# Altium schematic sheet Radar.SchDoc
size A; SheetNumber: 2; SheetTotal: 3
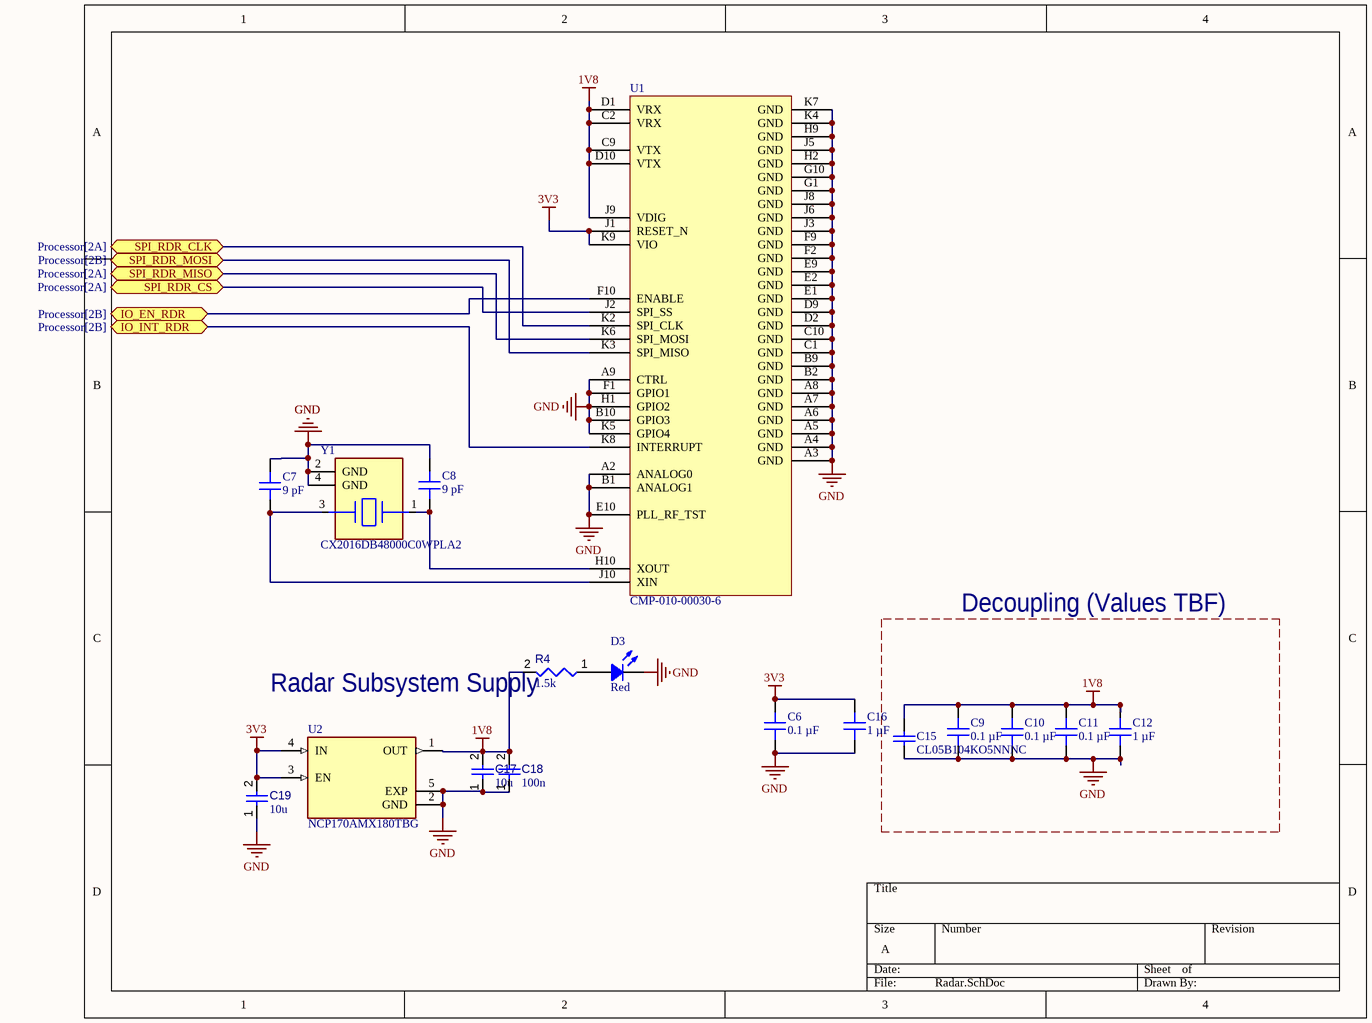
[diagram p0: Radar.SchDoc]

## Parts
C6  0.1 µF  [CAP 0402_1005]
C7  9 pF  [CAP 0402_1005]
C8  9 pF  [CAP 0402_1005]
C9  0.1 µF  [CAP 0402_1005]
C10  0.1 µF  [CAP 0402_1005]
C11  0.1 µF  [CAP 0402_1005]
C12  1 µF  [CAP 0402_1005]
C15  CL05B104KO5NNNC  [CAPC1050X55X23ML05T13]
C16  1 µF  [CAP 0402_1005]
C17  value 10u  [CAPC0402(1005)60_L]  (hidden comment: Capacitor 10µF +/-40% 6.3V 0402)
C18  value 100n  [CAPC0402(1005)60_L]  (hidden comment: Capacitor 10µF +/-40% 6.3V 0402)
C19  value 10u  [CAPC0402(1005)60_L]  (hidden comment: Capacitor 10µF +/-40% 6.3V 0402)
D3  Red  [LED 0402_1005 YELLOW]
R4  value 1.5k  [RESC1005X40X25ML05T05]  (hidden comment: Resistor 10k +/-1% 0402 63 mW)
U1  CMP-010-00030-6  [BGA50C50P10X10_520X550X90]
U2  NCP170AMX180TBG  [VREG_NCP170AMX180TBG]
Y1  CX2016DB48000C0WPLA2  [FP-CX2016DB48000C0WPLA2-MFG]

## Blocks framed on the sheet
Decoupling (Values TBF): C9-C12 C15

## Ports
IO_EN_RDR (bidir, see Processor[2B]), IO_INT_RDR (bidir, see Processor[2B]), SPI_RDR_CLK (bidir, see Processor[2A]), SPI_RDR_CS (bidir, see Processor[2A]), SPI_RDR_MISO (bidir, see Processor[2A]), SPI_RDR_MOSI (bidir, see Processor[2B])

## Nets
1V8: C9.2 C10.2 C11.2 C12.2 C15.2 C17.2 C18.2 R4.2 U1.C2(VRX) U1.C9(VTX) U1.D1(VRX) U1.D10(VTX) U1.J9(VDIG) U2.1(OUT)
3V3: C6.2 C16.2 C19.2 U1.J1(RESET_N) U1.K9(VIO) U2.3(EN) U2.4(IN)
GND: C6.1 C7.1 C8.1 C9.1 C10.1 C11.1 C12.1 C15.1 C16.1 C17.1 C18.1 C19.1 D3.2 U1.A2(ANALOG0) U1.A3(GND) U1.A4(GND) U1.A5(GND) U1.A6(GND) U1.A7(GND) U1.A8(GND) U1.A9(CTRL) U1.B1(ANALOG1) U1.B2(GND) U1.B9(GND) U1.B10(GPIO3) U1.C1(GND) U1.C10(GND) U1.D2(GND) U1.D9(GND) U1.E1(GND) U1.E2(GND) U1.E9(GND) U1.E10(PLL_RF_TST) U1.F1(GPIO1) U1.F2(GND) U1.F9(GND) U1.G1(GND) U1.G10(GND) U1.H1(GPIO2) U1.H2(GND) U1.H9(GND) U1.J3(GND) U1.J5(GND) U1.J6(GND) U1.J8(GND) U1.K4(GND) U1.K7(GND) U2.2(GND) U2.5(EXP) Y1.2(GND) Y1.4(GND)
IO_EN_RDR: U1.F10(ENABLE) ; port IO_EN_RDR
IO_INT_RDR: U1.K8(INTERRUPT) ; port IO_INT_RDR
SPI_RDR_CLK: U1.K2(SPI_CLK) ; port SPI_RDR_CLK
SPI_RDR_CS: U1.J2(SPI_SS) ; port SPI_RDR_CS
SPI_RDR_MISO: U1.K6(SPI_MOSI) ; port SPI_RDR_MISO
SPI_RDR_MOSI: U1.K3(SPI_MISO) ; port SPI_RDR_MOSI
NetC7_2: C7.2 U1.J10(XIN) Y1.3(2_HOT)
NetC8_2: C8.2 U1.H10(XOUT) Y1.1(1_HOT)
NetD3_1: D3.1 R4.1

Not connected (* = marked no-connect by the designer): U1 K5(GPIO4)

## Notes on the sheet
- (near R4) Radar Subsystem Supply

## Library data of the parts
C6 C9-C11 = C0402C104K7PAC7867: CAP CER 0.1UF 4V X5R 0402; manufacturer: KEMET; Tolerance: ±10%; Part Number: C0402C104K7PAC7867; Value: 0.1 µF; Applications: Bypass, Decoupling; Capacitance: 0.1 µF; componentlink1description: Datasheet; componentlink1url: https://api.kemet.com/component-edge/download/datasheet/C0402C104K7PAC7867.pdf; componentlink2description: DigiKey Link; componentlink2url: https://www.digikey.com/en/products/detail/kemet/C0402C104K7PAC7867/7381987; Device Package: 0402 (1005 Metric); lastupdated: 11/9/2022 9:36:31 am; Lifecycle Status: Active; Minimum Order: 1; Mounting Type: Surface Mount, MLCC; Operating Temperature: -55°C ~ 85°C; Package / Case: 0402 (1005 Metric); packaging: TapeAndReel; partid: 5603; Part Status: Active; price: 0.01; series: SMD Comm X5R; Size / Dimension: 0.039" L x 0.020" W (1.00mm x 0.50mm); Supplier 1: DigiKey; Supplier Part Number 1: 399-14871-1-ND; Temperature Coefficient: X5R; Thickness (Max): 0.022" (0.55mm); Voltage - Rated: 4V
C7 C8 = CGA2B2C0G1H090D050BA: CAP CER 9PF 50V C0G 0402; manufacturer: TDK Corporation; Temperature Coefficient: C0G, NP0; Tolerance: ±0.5pF; Part Number: CGA2B2C0G1H090D050BA; Value: 9 pF; Applications: Automotive; Capacitance: 9 pF; componentlink1description: Datasheet; componentlink1url: https://product.tdk.com/info/en/catalog/datasheets/mlcc_automotive_general_en.pdf?ref_disty=digikey; componentlink2description: DigiKey Link; componentlink2url: https://www.digikey.com/en/products/detail/tdk-corporation/CGA2B2C0G1H090D050BA/2443061; Device Package: 0402 (1005 Metric); lastupdated: 14/9/2022 7:45:59 am; Lifecycle Status: Active; Minimum Order: 1; Mounting Type: Surface Mount, MLCC; Operating Temperature: -55°C ~ 125°C; Package / Case: 0402 (1005 Metric); packaging: TapeAndReel; partid: 7122; Part Status: Active; price: 0.01; Ratings: AEC-Q200; series: CGA; Size / Dimension: 0.039" L x 0.020" W (1.00mm x 0.50mm); Supplier 1: DigiKey; Supplier Part Number 1: 445-5583-1-ND; Thickness (Max): 0.022" (0.55mm); Voltage - Rated: 50V
C12 C16 = LMK105C6105KV-F: CAP CER 1UF 10V X6S 0402; manufacturer: Taiyo Yuden; Tolerance: ±10%; Part Number: LMK105C6105KV-F; Value: 1 µF; Applications: SMPS Filtering; Capacitance: 1 µF; componentlink1description: Datasheet; componentlink1url: https://www.yuden.co.jp/productdata/catalog/mlcc01_e.pdf; componentlink2description: DigiKey Link; componentlink2url: https://www.digikey.com/en/products/detail/taiyo-yuden/LMK105C6105KV-F/4157226; Device Package: 0402 (1005 Metric); lastupdated: 11/9/2022 9:36:40 am; Lifecycle Status: Active; Minimum Order: 1; Mounting Type: Surface Mount, MLCC; Operating Temperature: -55°C ~ 105°C; Package / Case: 0402 (1005 Metric); packaging: TapeAndReel; partid: 2215; Part Status: Active; price: 0.01; series: M; Size / Dimension: 0.039" L x 0.020" W (1.00mm x 0.50mm); Supplier 1: DigiKey; Supplier Part Number 1: 587-3409-1-ND; Temperature Coefficient: X6S; Thickness (Max): 0.022" (0.55mm); Voltage - Rated: 10V
C15 = CMP-2000-05439-1: Chip Capacitor, 100 nF, +/- 10%, 16 V, -55 to 125 degC, 0402 (1005 Metric), RoHS, Tape and Reel; Manufacturer: Samsung Electro-Mechanics; Capacitance: 100000pF; Dielectric: X7R; Rated Voltage: 16V; Case Size/Dimension: 0402; Tolerance (%): ±10%; Manufacturer URL: http://www.samsungsem.com/global/index.jsp; Datasheet URL: https://datasheet.ciiva.com/29198/458718-da-01-en-vs-kondensator-0402-29198423.pdf; Datasheet Version: Nov-10
C17 C19 = CMP-001-00074-3: Chip Capacitor, 10µF +/-40%, 6.3V, 0402, Thickness 0.6 mm; Tolerance: 10%; Case/Package: 0402; Pins: 2; Mounting Technology: SMT; Voltage Rating: 6.3V; Max Operating Temperature: 85°C; Min Operating Temperature: -55°C
C18 = CMP-001-00074-3: Chip Capacitor, 0.1µF +/-40%, 6.3V, 0402, Thickness 0.6 mm; Tolerance: 10%; Case/Package: 0402; Pins: 2; Mounting Technology: SMT; Voltage Rating: 6.3V; Max Operating Temperature: 85°C; Min Operating Temperature: -55°C
D3 = BL-HKC37A-AV-TRB: 0402 RED; Manufacturer: American Bright Optoelectronics Corporation; Color: Yellow; Configuration: Standard; Current - Test: 20mA; Lens Color: Colorless; Lens Style: Rectangle with Flat Top; Lens Transparency: Clear; Millicandela Rating: 120mcd; Viewing Angle: 120°; Voltage - Forward (Vf) (Typ): 2.2V; Wavelength - Dominant: 589nm; Wavelength - Peak: 590nm; Part Number: BL-HKC37A-AV-TRB; ComponentLink1Description: Datasheet; ComponentLink1URL: https://americanbrightled.com/pdffiles/smt/BL-HKC37A-AV-TRB.pdf; ComponentLink2Description: DigiKey Link; ComponentLink2URL: https://www.digikey.com/en/products/detail/american-bright-optoelectronics-corporation/BL-HKC37A-AV-TRB/9678171; Device Package: 0402 (1005 Metric); Height (Max): 0.45mm; LastUpdated: 11/9/2022 10:29:51 am; Lifecycle Status: Active; Minimum Order: 1; Mounting Type: Surface Mount; Package / Case: 0402 (1005 Metric); Packaging: TapeAndReel; PartId: 1041; Part Status: Active; Price: 0.06; Series: -; Size / Dimension: 1.00mm L x 0.50mm W; Supplier 1: DigiKey; Supplier Part Number 1: BL-HKC37A-AV-TRBCT-ND; Supplier Device Package: 0402; Value: Red
R4 = CMP-009-00019-5: Chip Resistor, 1.5 KOhm, +/- 1%, 63 mW, -55 to 155 degC, 0402 (1005 Metric); Power: 63mW; Voltage Rating: 50V; Case/Package: 0402; Mounting Technology: SM; Pins: 2; Min Operating Temperature: -55°C; Tolerance: 1%; RoHS Compliant: True; Max Operating Temperature: 155°C
U1 = CMP-349-000000-1: Acconeer A121 pulsed coherent 60 GHz radar sensor; Manufacturer: Acconeer AB; Case/Package: BGA; Max Operating Tempereture: 85; Min Operating Temperature: -40°C; Mounting Type: SMD; Package Size: 5.2 x 5.5 x 0.88 mm; RoHS Compliant: Yes; Source: A121-001-T&R.SchLib; Design Item ID: CMP-010-00030-6; Package: fcCSP50
U2 = CMP-031-00006-1: Linear Voltage Regulator IC 1 Output 150mA 4-XDFN (1x1); Design Item ID: NCP170AMX180TBG; MP: NCP170AMX180TBG; Availability: Unavailable; Component Type: Standard; Case/Package: None; Value: *; Price: None; Pins: 5; Source: NCP170AMX180TBG.SchLib
Y1 = CMP-20727-000003-1: CRYSTAL 48.0000MHZ 7PF SMD; Manufacturer: Kyocera; Tolerance: 20ppm; Esr: 22Ω; Frequency: 48000kHz; Height: 0.45mm; Load Capacitance: 7pF; Temperature: -40°C to +85°C; Automotive: No; Temperature Range High: +85°C; Octopart: https://octopart.com/cx2016db48000c0wpla2-avx+%2F+kyocera-52876167; Device Class L2: Crystals / Oscillators; Lead Free: Yes; Digikey Description: CRYSTAL 48.0000MHZ 7PF SMD; Mouser Description: Crystals 48MHz 7pF; Device Class L1: Passive Components; RoHS: TRUE; Temperature Range Low: -40°C; Package: 0; ComponentLink2Description: Datasheet; Device Class L3: Crystals; Series: CX2016DB; Category: Crys; ComponentLink2URL: https://global.kyocera.com/prdct/electro/product/pdf/cx2016db_e.pdf; Manufacturer Part Number: CX2016DB48000C0WPLA2